# Altium schematic sheet Sheet1.SchDoc
size A; SheetNumber: 1; SheetTotal: 1
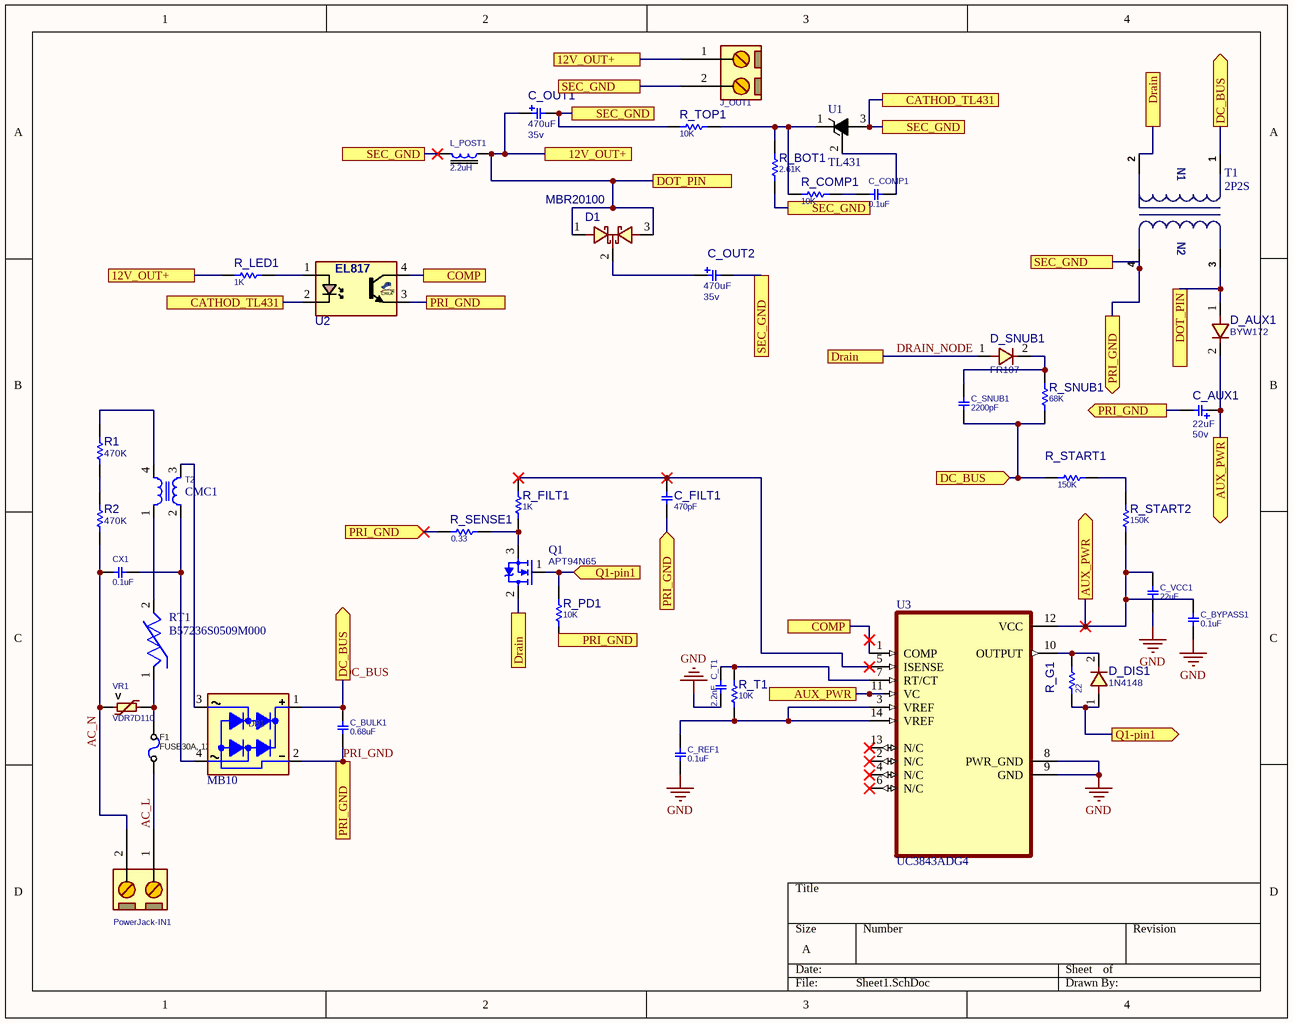
[diagram p0: Sheet1.SchDoc]

## Parts
C_AUX1  PARAM2: 50v  [C_EL_D6L5]  (hidden comment: 22uF)
C_BULK1  0.68uF  [C1210]
C_BYPASS1  0.1uF  [C0402]
C_COMP1  0.1uF  [C0402]
C_FILT1  470pF  [C0402]
C_OUT1  PARAM2: 35v  [C_EL_D10L10]  (hidden comment: 470uF)
C_OUT2  PARAM2: 35v  [C_EL_D10L10]  (hidden comment: 470uF)
C_REF1  0.1uF  [C0402]
C_SNUB1  2200pF  [C0402]
C_T1  2.2nF  [C0402]
C_VCC1  22uF  [C1206]
CX1  0.1uF  [C0402]
D1  MBR20100  [TO220_3]
D_AUX1  BYW172  [D_AX06_SOD64]
D_DIS1  1N4148  [D_AX02_DO35]
D_SNUB1  FR107  [D_AX04_DO41]
DB1  MB10  [DBRG_DIPSMD]
F1  FUSE30A, 125V  [FUSH_6X32MM_4PIN]
J_OUT1  CONN_TB2  [TBG_2]  (value not drawn)
L_POST1  2.2uH  [L_6]
PowerJack-IN1  CONN_TB2  [TBG_2]  (value not drawn)
Q1  APT94N65  [TO247_3]
R1  470K  [R1206]
R2  470K  [R1206]
R_BOT1  2.61K  [R2W_AX08]
R_COMP1  10K  [R2W_AX08]
R_FILT1  1K  [R1W_AX06]
R_G1  22  [R1W_AX06]
R_LED1  1K  [R2W_AX08]
R_PD1  10K  [R1W_AX06]
R_SENSE1  0.33  [R1W_AX06]
R_SNUB1  68K  [R1W_AX06]
R_START1  150K  [R025W_AX04]
R_START2  150K  [R025W_AX04]
R_T1  10K  [R025W_AX04]
R_TOP1  10K  [R2W_AX08]
RT1  B57236S0509M000  [THRMRB500W60L1150T500H1600]
T1  2P2S  [Transformer 4 Leads]
T2  CMC1  [CMCHOKE_UU16]
U1  TL431  [SOT23_3]
U2  EL817  [DIP_4SMD]  (value not drawn)
U3  UC3843ADG4  [SOIC127P600X175-14N]
VR1  VDR7D110  [MOV_7D]

## Ports
12V_OUT+, AUX_PWR, AUX_PWR (out), CATHOD_TL431, COMP, DC_BUS (in), DC_BUS (out), DOT_PIN, Drain, PRI_GND, PRI_GND (in), PRI_GND (out), Q1-pin1 (in), Q1-pin1 (out), SEC_GND

## Nets
GND: C_BYPASS1.2 C_REF1.2 C_T1.1 C_VCC1.2 U3.8(PWR_GND) U3.9(GND)
12V_OUT+: C_OUT1.1 D1.1 D1.3 D_AUX1.1 J_OUT1.1 L_POST1.1 R_LED1.1 T1.3 ; port DOT_PIN, port 12V_OUT+
AC_L: F1.1 PowerJack-IN1.1
AC_N: CX1.1 PowerJack-IN1.2 R2.1 VR1.1
AUX_PWR: C_AUX1.1 C_BYPASS1.1 C_VCC1.1 D_AUX1.2 R_START2.1 U3.11(VC) U3.12(VCC) ; port AUX_PWR
COMP: U2.4(C) U3.1(COMP) ; port COMP
DC_BUS: C_BULK1.1 C_SNUB1.1 DB1.1(DCOUT+) R_SNUB1.1 R_START1.1 T1.1 ; port DC_BUS
DRAIN_NODE: D_SNUB1.1 Q1.2(D) T1.2 ; port Drain
PRI_GND: C_AUX1.2 C_BULK1.2 C_FILT1.1 C_OUT1.2 C_OUT2.2 DB1.2(DCOUT-) J_OUT1.2 L_POST1.2 R_BOT1.2 R_PD1.1 R_SENSE1.1 R_TOP1.1 T1.4 U1.3(A) U2.2(K) U2.3(E) ; port PRI_GND, port SEC_GND, port CATHOD_TL431
Q1-pin1: D_DIS1.1 Q1.1(G) R_G1.1 R_PD1.2 ; port Q1-pin1
NetC_COMP1_1: C_COMP1.1 R_COMP1.2
NetC_COMP1_2: C_COMP1.2 U1.2(REF)
NetC_FILT1_2: C_FILT1.2 R_FILT1.2 U3.5(ISENSE)
NetC_OUT2_1: C_OUT2.1 D1.2
NetC_REF1_1: C_REF1.1 R_T1.2 U3.3(VREF) U3.14(VREF)
NetC_SNUB1_2: C_SNUB1.2 D_SNUB1.2 R_SNUB1.2
NetC_T1_2: C_T1.2 R_T1.1 U3.7(RT/CT)
NetCX1_2: CX1.2 DB1.4(ACIN1) T2.2
NetD_DIS1_2: D_DIS1.2 R_G1.2 U3.10(OUTPUT)
NetDB1_3: DB1.3(ACIN2) T2.3
NetF1_2: F1.2 RT1.1 VR1.2
NetQ1_3: Q1.3(S) R_FILT1.1 R_SENSE1.2
NetR1_1: R1.1 R2.2
NetR1_2: R1.2 T2.4
NetR_BOT1_1: R_BOT1.1 R_COMP1.1 R_TOP1.2 U1.1(K)
NetR_LED1_2: R_LED1.2 U2.1(A)
NetR_START1_2: R_START1.2 R_START2.2
NetRT1_2: RT1.2 T2.1

Not connected (* = marked no-connect by the designer): U3 2(N/C)* 4(N/C)* 6(N/C)* 13(N/C)*

## Notes on the sheet
- (in symbol Transformer 2P2S) N1; N2
- (in symbol VARISTOR_B72207S011_MOV7) V

## Library data of the parts
C_AUX1 = CAP_SMD_EL_22uF_50v: CAP, SMD, ELEC,; MANF_P#: MANF_PART#; DESC: DESCRIPTION; DIST#: MOUSER; PARAM: 20%; PRICE: 10= -$; MANF: MANF; ASSEMBLY: ASSEMBLY; VALUE: 22uF
C_BULK1 = CAP_SMD_MLCC_68n1kv: CAP, MLCC; MANF_P#: C1210W683KDRACTU; MANF: KEMET; PARAM: X7R, 10%, -55~125oC; PARAM2: 1000V; PRICE: 1$; VALUE: 0.68uF
C_BYPASS1 C_REF1 CX1 = CAP_SMD_MLCC_100n50T: CAP, MLCC, 100nF, 50V, X5R, 10%, 0402C; PARAM: X5R, 10%, -55~85oC; MANF_P#: UMK105BJ104KV-F; MANF: Taiyo Yuden; PARAM2: 50V; ASSEMBLY: ASSEMBLY; PRICE: 100= 3.8$; VALUE: 0.1uF
C_COMP1 = CAP_SMD_MLCC_100n35T: CAP, MLCC, 100nF, 35V, X5R, 10%, 0402C; PARAM: X5R, 10%, -55~85oC; MANF_P#: GMK105BJ104KV-F; MANF: Taiyo Yuden; PARAM2: 35V; ASSEMBLY: ASSEMBLY; PRICE: 100= 4$; VALUE: 0.1uF
C_FILT1 = CAP_SMD_MLCC_470p50V: CAP, MLCC, 50V, C0G, 5%; MANF_P#: GCM1555C1H471JA16J; MANF: MURATA; PARAM: C0G, 5%; DIST#: MOUSER; ASSEMBLY: ASSEMBLY; PRICE: 100= 2$; DESC: CAP, MLCC; PARAM2: 50V; VALUE: 470pF
C_OUT1 C_OUT2 = CAP_SMD_EL_470uF_35v: CAP, SMD, ELEC,; MANF_P#: MANF_PART#; DESC: DESCRIPTION; DIST#: MOUSER; PARAM: 20%; PRICE: 10= -$; MANF: MANF; ASSEMBLY: ASSEMBLY; VALUE: 470uF
C_SNUB1 C_T1 = CAP_SMD_MLCC_2.2n50V: CAP, MLCC; PARAM: X7R, 5%, -55~125oC; MANF_P#: GCM155R71H222JA37D; MANF: Murata; PARAM2: 50V; ASSEMBLY: ASSEMBLY; PRICE: 100= 2$
  C_SNUB1: VALUE: 2200pF
  C_T1: VALUE: 2.2nF
C_VCC1 = CAP_SMD_MLCC_22u35V: CAP, MLCC, X5R 22uF 35V 20% 1206; PARAM: X5R, 20%; MANF_P#: C3216X5R1V226M160AC; MANF: TDK; DESC: CAP, MLCC, 22uF, 25V, X5R,  20%, 1206; PARAM2: 35V; PRICE: 1.2$; VALUE: 22uF
D1 = DIODE_THD_SCHOTTKY_MBR20100: DIODE, SCHOTTKY, DUAL, 100V, 20A; MANF: Diodes; DESC: DESCRIPTION; MANF_P#: MBR20100; ASSEMBLY: ASSEMBLY; PRICE: PRICE; PARAM2: 100V; PARAM: 20A; VALUE: MBR20100
D_AUX1 = DIODE_THD_BYW172: DIODE, FAST; MANF: VISHAY; DESC: DESCRIPTION; PARAM: 200V; PARAM2: 3A; ASSEMBLY: ASSEMBLY; PRICE: PRICE; MANF_P#: BYW172; VALUE: BYW172
D_DIS1 = DIODE_THD_1N4148_DO35: DIODE, FAST SWTICHING, THD; DESC: DESCRIPTION; PARAM: 75V; PARAM2: 0.3A; MANF: MANF; ASSEMBLY: ASSEMBLY; PRICE: PRICE; MANF_P#: 1N4148; VALUE: 1N4148
D_SNUB1 = DIODE_THD_1N4002: DIODE, GENERAL PURPOSE, 100V/1A; DESC: DESCRIPTION; PARAM: 100V; PARAM2: 1A; MANF_P#: 1N4002; MANF: MANF; ASSEMBLY: ASSEMBLY; PRICE: PRICE; VALUE: FR107
DB1 = DIODE_SMD_BRIDGE_MB10: DIODE, BRIDGE, SMD; MANF: MCC, DIODES; MANF_P#: MB10F, MB10S; PARAM2: 1000V; PARAM: 0.5A; VALUE: MB10
F1 = FUSE_6X32: Fuse HOLDER 5X20; PARAM: 30A; MANF_P#: MANF_PART#; PARAM2: 125VAC; MANF: MANF; VALUE: FUSE30A, 125V
J_OUT1 PowerJack-IN1 = CONN_TB2: CONN, TERMINAL BLOCK, 5.08mm pitch; VALUE: CONN_TB2
L_POST1 = IND_SMD_2.2uH_3.75A: INDUCTOR, 2.2uH 3.75A, 20mOhm; PARAM: 3.75A Irms, 5.1A Isat, -40~125oC; MANF_P#: TYS60282R2N-10; MANF: LARID; PRICE: 0.34$; PARAM2: 20mOhm; ASSEMBLY: ASSEMBLY; VALUE: 2.2uH
Q1 = MOSN_APT94N65_TO247: MOSFET N-CH, 650V, 94A, 300mRDS; PARAM2: 650V, 5200pF; PARAM: 94A, 300mRDS, -55~150°C; MANF: MICROSEMI; ASSEMBLY: ASSEMBLY; MANF_P#: APT94N65; PRICE: 70t@PAYA; VALUE: APT94N65
R1 R2 = RES_SMD_1206: RESISTOR, SMD; PARAM: 1%, 0.25W; DESC: DESCRIPTION; DIST#: MOUSER; MANF_P#: -; MANF: -; ASSEMBLY: ASSEMBLY; PRICE: -; PARAM2: -; VALUE: 470K
R_BOT1 R_COMP1 R_FILT1 R_G1 R_LED1 R_PD1 R_SENSE1 R_SNUB1 R_START1 R_START2 R_T1 R_TOP1 = RES_THD: RESISTOR, THD; MANF_P#: RK73H1ETTP4701F; MANF: KOA SPEER; PARAM: 0.063W; DESC: DESCRIPTION; DIST#: MOUSER; PARAM2: 1%; ASSEMBLY: ASSEMBLY; PRICE: 100= 0.5$
  R_BOT1: VALUE: 2.61K
  R_COMP1 R_PD1 R_T1 R_TOP1: VALUE: 10K
  R_FILT1 R_LED1: VALUE: 1K
  R_G1: VALUE: 22
  R_SENSE1: VALUE: 0.33
  R_SNUB1: VALUE: 68K
  R_START1 R_START2: VALUE: 150K
RT1 = B57236S0509M000: ICL 5 OHM 20% 4.5A 11.5MM; MF: EPCOS - TDK Electronics; SnapEDA_Link: https://www.snapeda.com/parts/B57236S0509M000/TDK/view-part/?ref=snap; Package: None; Value: *; MP: B57236S0509M000; Check_prices: https://www.snapeda.com/parts/B57236S0509M000/TDK/view-part/?ref=eda
T1 = Transformer 2P2S: Transformer 2 Primary , 2 Secondry; Voltage Ratio: 220:9; Power: 100W; MF: Zettler; MP: Transformer 2P2S; Package: =Footprint; Publisher: Majid Derhambakhsh
T2 = EMI_TRANS_CMCHOKE_UU16: Choke, Common Mode, UU16; MANF: -; MANF_P#: UU16; PARAM: -; PRICE: -; VALUE: CMC1
U1 = TL431_SOT23: VREF, Programmable Precision; MANF_P#: TL431_SOT23; VALUE: TL431; PACKAGE: SOT23-3
U2 = OPTC_TR4P_EL817_SMD: OPTOCOUPLER, TRANSISTOR, 4PIN; PARAM: IF=5mA; PARAM2: VCE = 5V; PRICE: 300t@Paya; VALUE: EL817; PACKAGE: DIP-4SMD
U3 = UC3843ADG4: 30-V, 1A, 500KHz current mode PWM controller with 8.4V/7.6V UVLO 100% duty cycle 0C to 70C 14-SOIC 0 to 70; MF: Texas Instruments; SnapEDA_Link: https://www.snapeda.com/parts/UC3843ADG4/Texas+Instruments/view-part/?ref=snap; Package: SOIC-14 Texas Instruments; Value: *; MP: UC3843ADG4; Check_prices: https://www.snapeda.com/parts/UC3843ADG4/Texas+Instruments/view-part/?ref=eda
VR1 = VARISTOR_B72207S011_MOV7: Varistor, 14VDC/11VAC, MOV7; MANF: EPCOS / TDK; PARAM2: 14VDC, 11VAC, 36VCLAMP; MANF_P#: B72207S0110K211; PARAM: 250A-ITM, -40~85oC; PRICE: 0.45$; VALUE: VDR7D110